# EAGLE design controle rpm (EAGLE 6.5.0)
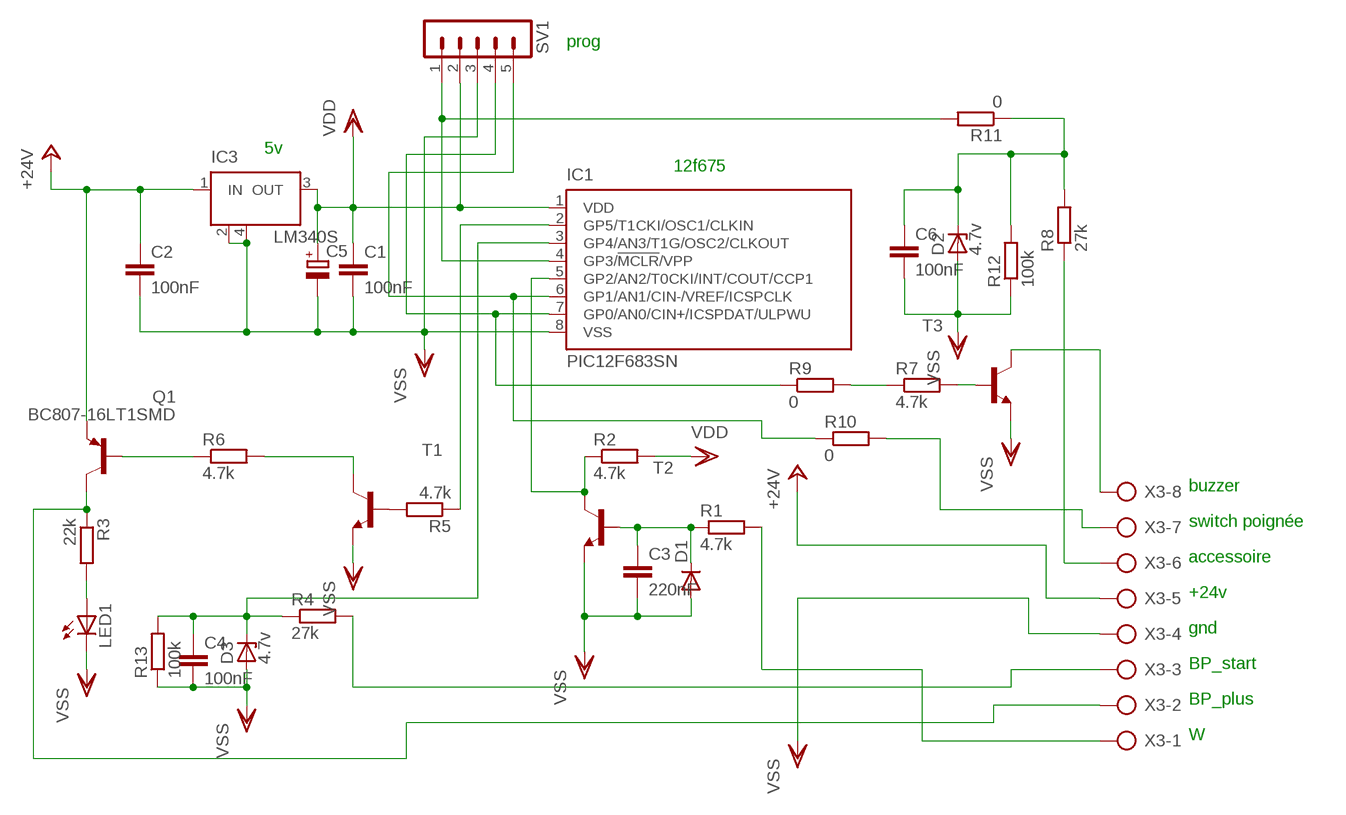
[diagram p0: schematic, sheet 1]

## Parts
C1  100nF  C-EUC0603K  [C0603K]
C2  100nF  C-EUC0603K  [C0603K]
C3  220nF  C-EUC0603K  [C0603K]
C4  100nF  C-EUC0603K  [C0603K]
C5  CPOL-EUSMCC  [SMC_C]
C6  100nF  C-EUC0603K  [C0603K]
D1  DIODE-MINIMELF  [MINIMELF]
D2  4.7v  ZENER-DIODESOD80C  [SOD80C]
D3  4.7v  ZENER-DIODESOD80C  [SOD80C]
IC1  PIC12F683SN  [SO-08]
IC3  LM340S  [SOT223]
LED1  LEDCHIP-LED0805  [CHIP-LED0805]
Q1  BC807-16LT1SMD  [SOT23-BEC]
R1  4.7k  R-EU_R0805  [R0805]
R2  4.7k  R-EU_R0805  [R0805]
R3  22k  R-EU_R1206  [R1206]
R4  27k  R-EU_R1206  [R1206]
R5  4.7k  R-EU_R0805  [R0805]
R6  4.7k  R-EU_R0805  [R0805]
R7  4.7k  R-EU_R0805  [R0805]
R8  27k  R-EU_R1206  [R1206]
R9  0  R-EU_R0603  [R0603]
R10  0  R-EU_R0603  [R0603]
R11  0  R-EU_R0603  [R0603]
R12  100k  R-EU_R0805  [R0805]
R13  100k  R-EU_R0805  [R0805]
SV1  MA05-1  [MA05-1]
T1  BC817-16-NPN-SOT23-BEC  [SOT23-BEC]
T2  BC817-16-NPN-SOT23-BEC  [SOT23-BEC]
T3  BC817-16-NPN-SOT23-BEC  [SOT23-BEC]
X3  AK300/8  [AK300/8]

## Nets
+24V: C2.1 IC3.1(IN) Q1.E X3.5
N$1: IC1.5(GP2/AN2/T0CKI/INT/COUT/CCP1) R2.1 T2.C
N$2: C3.1 D1.C R1.1 T2.B
N$3: IC1.4(GP3/!MCLR!/VPP) R11.2 SV1.1
N$4: IC1.7(GP0/AN0/CIN+/ICSPDAT/ULPWU) R9.1 SV1.4
N$5: IC1.6(GP1/AN1/CIN-/VREF/ICSPCLK) R10.1 SV1.5
N$6: Q1.B R6.1
N$7: C4.1 D3.C IC1.3(GP4/AN3/T1G/OSC2/CLKOUT) R4.1 R13.2
N$8: LED1.A R3.2
N$10: R5.2 T1.B
N$11: R6.2 T1.C
N$12: Q1.C R3.1 X3.2
N$13: R1.2 X3.1
N$14: IC1.2(GP5/T1CKI/OSC1/CLKIN) R5.1
N$15: R7.2 T3.B
N$16: R7.1 R9.2
N$17: R4.2 X3.3
N$20: R8.1 X3.6
N$21: R10.2 X3.7
N$22: T3.C X3.8
N$23: C6.1 D2.C R8.2 R11.1 R12.2
VDD: C1.1 C5.+ IC1.1(VDD) IC3.3(OUT) R2.2 SV1.2
VSS: C1.2 C2.2 C3.2 C4.2 C5.- C6.2 D1.A D2.A D3.A IC1.8(VSS) IC3.2(GND) IC3.4(GND) LED1.C R12.1 R13.1 SV1.3 T1.E T2.E T3.E X3.4

## Notes on the sheet
- prog
- 5v
- 12f675
- buzzer
- switch poignée
- accessoire
- +24v
- gnd
- BP_start
- BP_plus
- W

## Library data of the parts
C1-C4 C6 = rcl:C-EU: CAPACITOR, European symbol
C5 = rcl:CPOL-EU: POLARIZED CAPACITOR, European symbol
D1 = diode:DIODE-: DIODE
D2 D3 = diode:ZENER-DIODE: Z-Diode
IC1 = microchip:PIC12F683: 8-Pin Flash-Based, 8-Bit CMOS Microcontrollers with nanoWatt Technology Source: http://ww1.microchip.com/downloads/en/DeviceDoc/41211D_.pdf; MF: MICROCHIP; MPN: PIC12F683-I/SN; OC_FARNELL: 9759042; OC_NEWARK: 61K3434
IC3 = linear:LM340S: 3-Terminal Positive Regulators Source: http://cache.national.com/ds/LM/LM340.pdf
LED1 = led:LED: LED OSRAM: - CHIPLED LG R971, LG N971, LY N971, LG Q971, LY Q971, LO R971, LY R971 LH N974, LH R974 LS Q976, LO Q976, LY Q976 LO Q996 - Hyper CHIPLED LW Q18S LB Q993, LB Q99A, LB R99A - SideLED LS A670, LO A670, LY A670, LG A670, LP A670 LB A673, LV A673, LT A673, LW A673 LH A674 LY A675 LS A676, LA A676, LO A676, LY A676, LW A676 LS A679, LY A679, LG A679 - Hyper Micro SIDELED® LS Y876, LA Y876, LO Y876, LY Y876 LT Y87S - SmartLED LW L88C, LW L88S LB L89C, LB L89S, LG L890 LS L89K, LO L89K, LY L89K LS L896, LA L896, LO L896, LY L896 - TOPLED LS T670, LO T670, LY T670, LG T670, LP T670 LSG T670, LSP T670, LSY T670, LOP T670, LYG T670 LG T671, LOG T671, LSG T671 LB T673, LV T673, LT T673, LW T673 LH T674 LS T676, LA T676, LO T676, LY T676, LB T676, LH T676, LSB T676, LW T676 LB T67C, LV T67C, LT T67C, LS T67K, LO T67K, LY T67K, LW E67C LS E67B, LA E67B, LO E67B, LY E67B, LB E67C, LV E67C, LT E67C LW T67C LS T679, LY T679, LG T679 LS T770, LO T770, LY T770, LG T770, LP T770 LB T773, LV T773, LT T773, LW T773 LH T774 LS E675, LA E675, LY E675, LS T675 LS T776, LA T776, LO T776, LY T776, LB T776 LHGB T686 LT T68C, LB T68C - Hyper Mini TOPLED® LB M676 - Mini TOPLED Santana® LG M470 LS M47K, LO M47K, LY M47K Source: http://www.osram.convergy.de LUXEON: - LUMILED® LXK2-PW12-R00, LXK2-PW12-S00, LXK2-PW14-U00, LXK2-PW14-V00 LXK2-PM12-R00, LXK2-PM12-S00, LXK2-PM14-U00 LXK2-PE12-Q00, LXK2-PE12-R00, LXK2-PE12-S00, LXK2-PE14-T00, LXK2-PE14-U00 LXK2-PB12-K00, LXK2-PB12-L00, LXK2-PB12-M00, LXK2-PB14-N00, LXK2-PB14-P00, LXK2-PB14-Q00 LXK2-PR12-L00, LXK2-PR12-M00, LXK2-PR14-Q00, LXK2-PR14-R00 LXK2-PD12-Q00, LXK2-PD12-R00, LXK2-PD12-S00 LXK2-PH12-R00, LXK2-PH12-S00 LXK2-PL12-P00, LXK2-PL12-Q00, LXK2-PL12-R00 Source: www.luxeon.com KINGBRIGHT: KA-3528ASYC Source: www.kingbright.com
Q1 = transistor-pnp:BC807*: PNP Transistror
R1-R13 = rcl:R-EU_: RESISTOR, European symbol
SV1 = con-lstb:MA05-1: PIN HEADER; OC_FARNELL: unknown; OC_NEWARK: unknown
T1-T3 = transistor:*-NPN-: NPN Transistror BF959 corrected 2008.03.06
X3 = con-ptr500:AK300/8: CONNECTOR; OC_FARNELL: unknown; OC_NEWARK: unknown

## Board
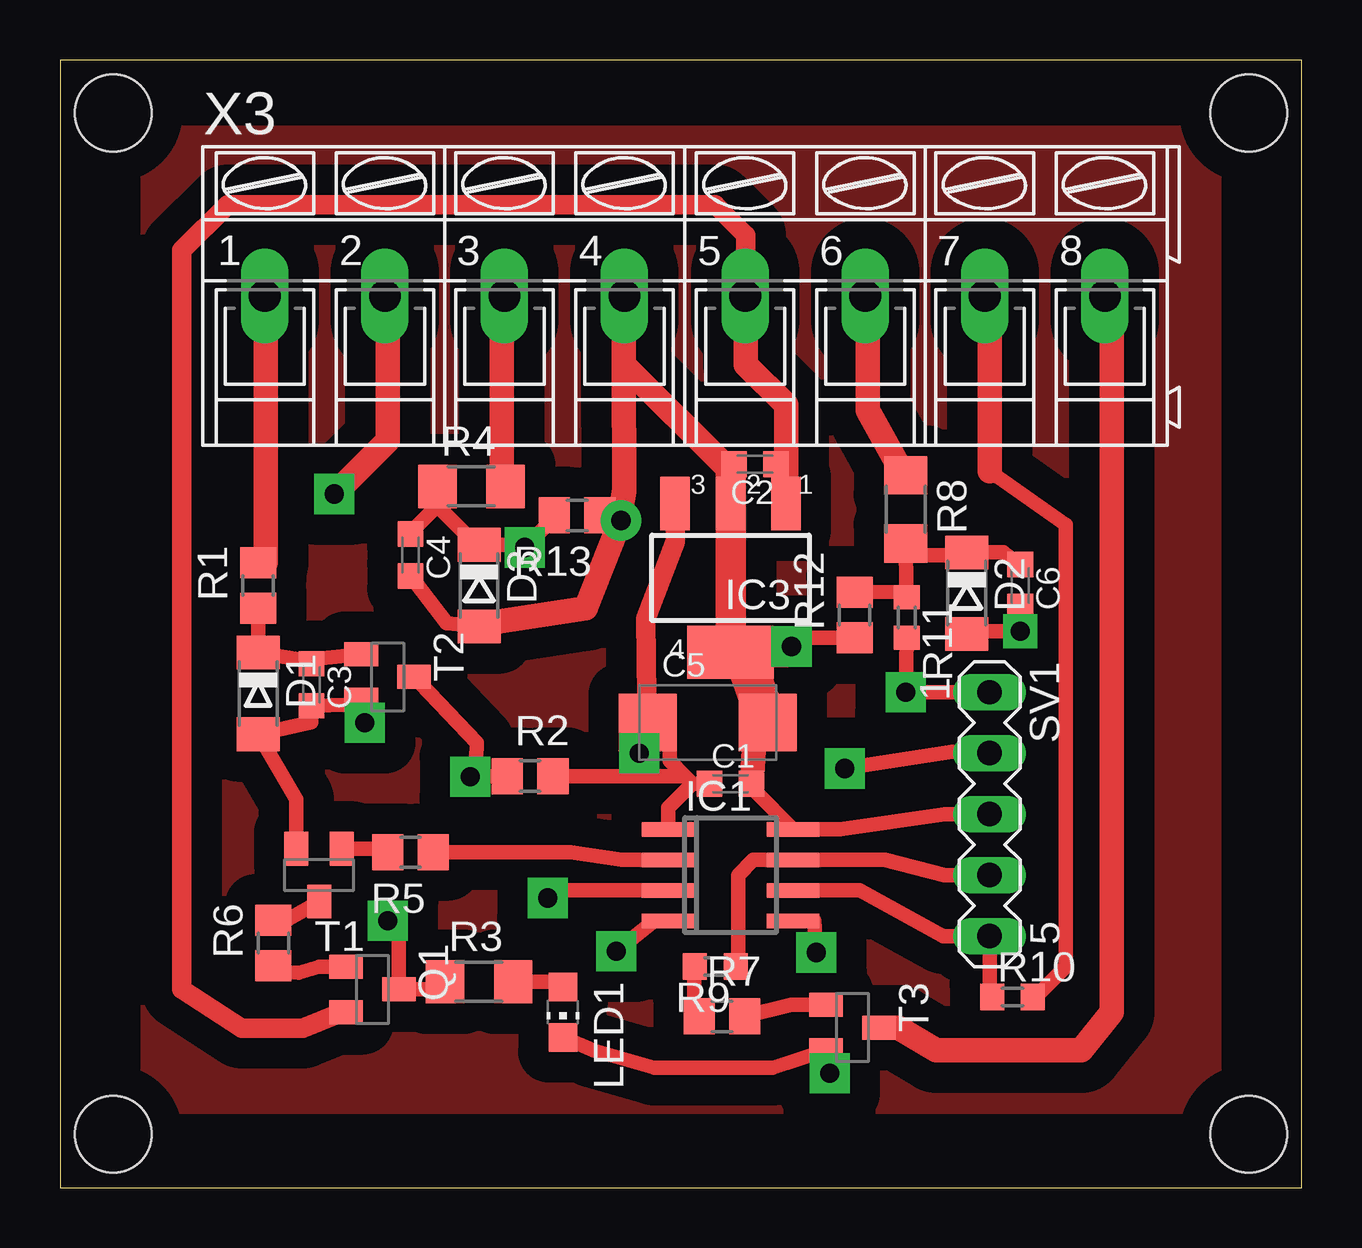
[diagram p1: board, top side]
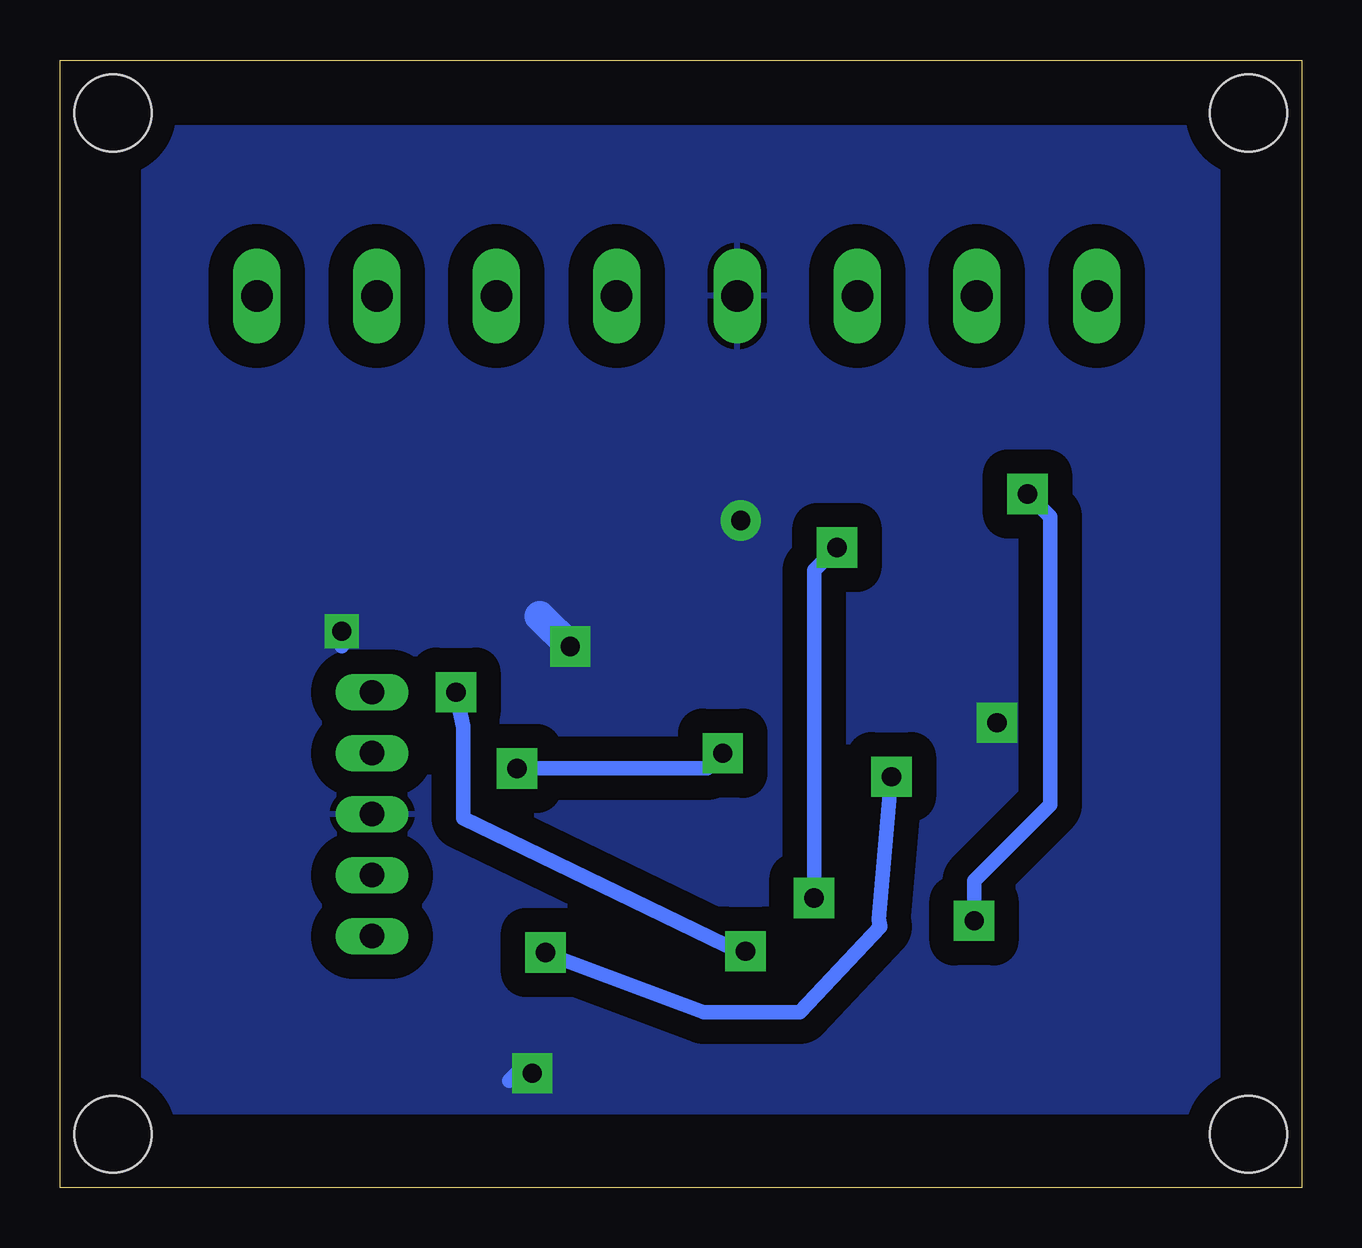
[diagram p2: board, bottom side, seen from below]

Size 51.74 x 46.98 mm. Coordinates in mm from the lower left corner, seen from the top.
Outline: 0,0 51.74,0 51.74,46.98 0,46.98 0,0
Copper layers (1*16): Top 0.035mm / dielectric 1.5mm / Bottom 0.035mm
Design rules "default": minimum track width 10mil, minimum drill 24mil, track to track 8mil, track to pad 8mil, pad to pad 8mil, via to via 8mil, smd to smd 8mil, copper to edge 40mil, drill to drill 8mil, minimum pad ring 10mil, minimum via ring 8mil, stop-mask expansion 4mil, vias tented up to drill 0mil, thermal gap 10mil
Holes 3.2 mm at 2.22,44.77 49.53,44.77 49.53,2.22 2.22,2.22

### Footprints (pad centres in the part's own frame; a part is rotated, then mirrored left to right if it is on the bottom)
C0603K = smd 1.05 x 1.08: 1 -0.875,0; 2 0.875,0
SMC_C = smd 2.4 x 2.4: + -2.5,0; - 2.5,0
MINIMELF = smd 1.4 x 1.8: A 1.7,0; C -1.7,0
SOD80C = smd 1.4 x 1.8: A 1.7,0; C -1.7,0
SO-08 = smd 0.6 x 2.2: 1 -1.905,-2.6; 2 -0.635,-2.6; 3 0.635,-2.6; 4 1.905,-2.6; 5 1.905,2.6; 6 0.635,2.6; 7 -0.635,2.6; 8 -1.905,2.6
SOT223 = smd 1.219 x 2.235: 1 -2.311,-3.099; 2 0,-3.099; 3 2.311,-3.099 | smd 3.6 x 2.2: 4 0,3.099
CHIP-LED0805 = smd 1.2 x 1.2: A 0,-1.05; C 0,1.05
SOT23-BEC = smd 1 x 1.4: B -0.95,-1.1; C 0,1.1; E 0.95,-1.1
R0805 = smd 1.3 x 1.5: 1 -0.95,0; 2 0.95,0
R1206 = smd 1.6 x 1.803: 1 -1.422,0; 2 1.422,0
R0603 = smd 1 x 1.1: 1 -0.85,0; 2 0.85,0
MA05-1 = drill 1.016 long: 1 -5.08,0; 2 -2.54,0; 3 0,0; 4 2.54,0; 5 5.08,0
AK300/8 = drill 1.321 long: 1 -17.501,0; 2 -12.497,0; 3 -7.518,0; 4 -2.515,0; 5 2.515,0; 6 7.518,0; 7 12.497,0; 8 17.501,0

### Placement (x,y rotation side)
C1  27.94,16.83 0 top
C2  28.96,30.13 180 top
C3  10.48,20.95 270 top
C4  14.61,26.35 270 top
C5  26.99,19.37 0 top
C6  40.01,25.08 270 top
D1  8.26,20.59 270 top
D2  37.78,24.77 270 top
D3  17.46,25.08 270 top
IC1  27.94,13.02 270 top
IC3  27.94,25.4 180 top
LED1  20.95,7.3 180 top
Q1  13.02,8.26 270 top
R1  8.26,25.08 90 top
R2  19.59,17.14 0 top
R3  17.46,8.57 0 top
R4  17.14,29.21 0 top
R5  14.61,13.97 180 top
R6  8.89,10.19 90 top
R7  27.58,7.13 0 top
R8  35.24,28.26 270 top
R9  27.3,9.21 180 top
R10  39.69,7.94 0 top
R11  35.28,23.75 270 top
R12  33.11,23.86 90 top
R13  21.55,28.01 180 top
SV1  38.73,15.56 270 top
T1  10.79,13.02 180 top
T2  13.65,21.27 270 top
T3  33.02,6.67 270 top
X3  26.04,37.15 0 top

### Tracks (layer width: path | path; a pad name or v marks a point on that pad's centre or on a via)
+24V
  Top 0.406: C2.1 30.19,30.13 30.25,30.07
  Top 0.61: 28.57,37.12 X3.5 28.57,37.17 | Q1.E 11.75,7.3
  Top 0.813: IC3.1 30.22,28.59 | 11.75,7.3 10.11,6.63 7.57,6.63 5.08,8.26 5.08,39.05 6.99,40.96 27.3,40.96 28.57,39.69 28.57,37.17
  Top 1.016: IC3.1 30.25,30.07 30.25,32.61 28.57,34.29 28.57,37.12
N$1  (via drill 0.8 pad 1.68)
  Top 0.61: T2.C 14.61,21.42 17.37,18.53 17.32,17.16 R2.1 v17.09,17.11 | IC1.5 31.43,11.11 v31.51,9.8
  Bottom 0.61: v31.51,9.8 31.33,9.71 24.93,7.3 20.93,7.3 17.57,10.88 17.63,11.18 v17.09,17.11
N$2
  Top 0.61: R1.1 D1.C 10.44,21.92 C3.1 10.7,22.04 T2.B
N$3  (via drill 0.8 pad 1.68)
  Top 0.61: SV1.1 v35.24,20.64 R11.2 | IC1.4 24.77,11.11 v23.18,9.84
  Bottom 0.61: v23.18,9.84 23.36,9.79 34.94,15.38 34.94,19.19 v35.24,20.64
N$4
  Top 0.61: SV1.4 36.85,13.02 34.37,13.65 IC1.7 28.89,13.65 28.26,13.02 28.26,9.31 R9.1
N$5
  Top 0.61: IC1.6 33.31,12.38 36.8,10.48 SV1.5 38.73,8.04 R10.1
N$6
  Top 0.61: Q1.B 10.79,9.21 9.95,8.96 9.05,8.97 R6.1
N$7  (via drill 0.8 pad 1.68)
  Top 0.61: C4.1 14.65,27.35 15.72,28.41 | 15.72,28.41 R4.1 | 15.72,28.41 17.35,26.78 D3.C 19.25,26.78 v19.37,26.67 20.64,27.95 R13.2 | v20.32,12.06 20.64,12.38 IC1.3
  Bottom 0.61: v19.37,26.67 20.32,25.72 v20.32,12.06
N$8
  Top 0.61: R3.2 20.74,8.57 LED1.A
N$9
  pour Top (isolate 1.27): 3.49,44.13 48.26,44.13 48.26,3.17 3.49,3.17
N$10
  Top 0.61: T1.B 13.51,14.12 R5.2
N$11
  Top 0.61: R6.2 9.46,11.16 T1.C
N$12  (via drill 0.8 pad 1.68)
  Top 0.61: R3.1 15.55,8.26 Q1.C 14.12,10.33 v13.65,11.11 | 13.65,37.03 X3.2
  Top 1.016: v11.43,28.89 13.65,31.11 13.65,37.03
  Bottom 0.61: v13.65,11.11 13.65,12.77 10.48,15.95 10.48,27.94 v11.43,28.89
N$13
  Top 0.61: R1.2 8.57,26.03 | 8.57,37.11 X3.1
  Top 1.016: 8.57,26.03 8.57,37.11
N$14
  Top 0.61: IC1.2 23.41,13.65 21.27,13.97 R5.1
N$15
  Top 0.61: T3.B 30.48,7.62 R7.2
N$16
  Top 0.61: R9.2 26.41,7.52 R7.1
N$17
  Top 0.61: 18.41,37.05 X3.3
  Top 1.016: 18.41,37.05 18.41,29.21 R4.2
N$20
  Top 0.61: 33.66,37.05 X3.6 | 35.24,29.53 R8.1
  Top 1.016: 35.24,29.53 33.66,32.38 33.66,37.05
N$21
  Top 0.61: R10.2 40.64,7.94 41.91,9.21 41.91,27.62 38.73,29.84 | 38.73,36.94 X3.7
  Top 1.016: 38.73,29.84 38.73,36.94
N$22
  Top 0.61: 43.81,36.87 X3.8
  Top 1.016: T3.C 34.92,6.67 36.51,5.71 42.55,5.71 43.81,7.3 43.81,36.87
N$23
  Top 0.254: 35.28,24.83 R11.1
  Top 0.61: R8.2 35.24,26.35 | 35.24,26.35 R11.1 | 35.24,26.35 37.67,26.35 D2.C 39.3,26.46 C6.1 | R12.2 35.28,24.83
VDD  (via drill 0.8 pad 1.68)
  Top 0.61: SV1.2 37.64,18.1 38.29,18.1 37.17,18.17 v32.7,17.46 | 24.45,20.41 C5.+ 25.4,19.28 25.4,17.78 26.04,17.14 | C1.1 26.35,16.83 | IC1.1 25.34,15.81 26.35,16.83 | R2.2 24.13,17.14 | 24.13,17.14 26.04,17.14 | 26.04,17.14 26.35,16.83 | v24.13,18.1 24.13,17.14
  Top 0.813: IC3.3 25.63,26.9 24.4,23.7 24.45,20.41
  Bottom 0.61: v32.7,17.46 24.77,17.46 v24.13,18.1
VSS  (via drill 0.8 pad 1.42, 0.8 pad 1.68)
  Top 0.254: R13.1 23.24,27.73 23.24,27.51
  Top 0.406: C2.2 27.9,30.13 27.78,30.01
  Top 0.61: T1.E 9.85,16.18 D1.A 10.48,19.38 C3.2 12.11,20.11 T2.E 12.55,20.17 v12.7,19.37 | SV1.3 36.87,15.56 32.51,14.92 IC1.8 28.94,16.52 C1.2 | IC3.4 28.57,22.3 | 28.57,22.3 28.7,22.3 | 23.5,37.12 X3.4 | 28.94,18.91 C5.- | 28.49,22.21 28.57,22.3 | LED1.C 22.23,5.71 24.77,4.99 29.7,4.99 T3.E 31.92,4.91 v32.07,4.76 | C4.2 16.12,23.52 D3.A 17.8,23.52 | C6.2 v40.01,23.18 37.9,23.18 D2.A | R12.1 30.99,22.91 30.92,22.98 v30.48,22.54
  Top 0.813: 30.54,22.98 v30.48,22.54
  Top 1.016: 27.94,29.84 27.78,30.01 23.5,34.29 | 23.5,34.29 23.5,37.12 | C1.2 28.94,18.91 | 17.8,23.52 21.91,24.13 23.24,27.51 23.5,29.04 23.5,34.29
  Top 1.27: 27.94,29.84 IC3.2 IC3.4 | 28.7,22.3 30.24,22.3 v30.48,22.54
  Top 1.676: C5.- 28.49,22.21
  Bottom 0.61: v32.07,4.76 32.7,4.76 33.02,4.45 | v12.7,19.37 12.7,19.05 13.02,19.37 | v40.01,23.18 40.01,22.54
  Bottom 1.27: v30.48,22.54 31.75,23.81
  other vias: 23.38,27.79
  pour Bottom (isolate 1.016): 3.49,44.13 48.26,44.13 48.26,3.17 3.49,3.17